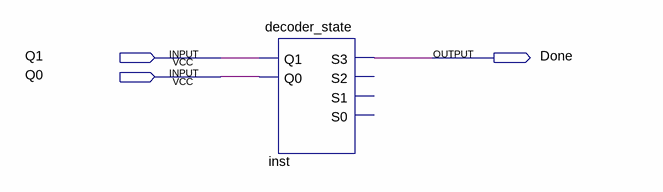
[diagram p0: schematic sheet]
// Quartus schematic Done.bdf as structural Verilog: 1 symbols, 3 pins
module Done (
  input  Q1,
  input  Q0,
  output Done
);

  decoder_state inst (.Q1(Q1), .Q0(Q0), .S3(Done));  // open: S2, S1, S0
endmodule
